# Altium schematic sheet Motor.SchDoc
size A4; SheetNumber: 4; SheetTotal: 12
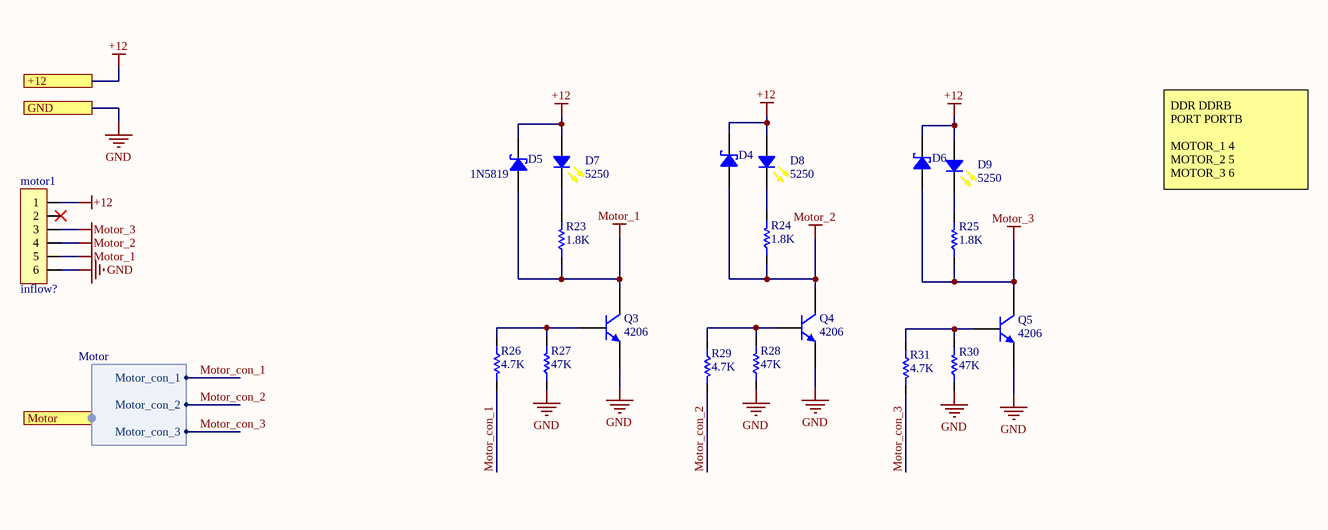
[diagram p0: Motor.SchDoc]

## Parts
D4  1N5819  [430X270D]  (value not drawn)
D5  1N5819  [430X270D]
D6  1N5819  [430X270D]  (value not drawn)
D7  Inflow: 5250  [LED 1206/3216 YELLOW]  (hidden comment: Yellow, 1206)
D8  Inflow: 5250  [LED 1206/3216 YELLOW]  (hidden comment: Yellow, 1206)
D9  Inflow: 5250  [LED 1206/3216 YELLOW]  (hidden comment: Yellow, 1206)
motor1  Inflow: inflow?  [MOLEX KK 0022272061]  (hidden comment: 6'Pin)
Q3  Inflow: 4206  [TO-220 AB]  (hidden comment: NPN)
Q4  Inflow: 4206  [TO-220 AB]  (hidden comment: NPN)
Q5  Inflow: 4206  [TO-220 AB]  (hidden comment: NPN)
R23  1.8K  [RES 1206 (3216X08L)]
R24  1.8K  [RES 1206 (3216X08L)]
R25  1.8K  [RES 1206 (3216X08L)]
R26  4.7K  [RES 1206 (3216X08L)]
R27  47K  [RES 1206 (3216X08L)]
R28  47K  [RES 1206 (3216X08L)]
R29  4.7K  [RES 1206 (3216X08L)]
R30  47K  [RES 1206 (3216X08L)]
R31  4.7K  [RES 1206 (3216X08L)]

## Ports
+12, GND, Motor (harness Motor)

## Harnesses
Motor: Motor_con_1, Motor_con_2, Motor_con_3

## Nets
+12: D4.2 D5.2 D6.2 D7.1 D8.1 D9.1 motor1.1 ; port +12
GND: motor1.6 Q3.3(E) Q4.3(E) Q5.3(E) R27.1 R28.1 R30.1 ; port GND
Motor_1: D5.1 motor1.5 Q3.2(C) R23.1
Motor_2: D4.1 motor1.4 Q4.2(C) R24.1
Motor_3: D6.1 motor1.3 Q5.2(C) R25.1
Motor_con_1: R26.2 ; port Motor.Motor_con_1
Motor_con_2: R29.2 ; port Motor.Motor_con_2
Motor_con_3: R31.2 ; port Motor.Motor_con_3
NetD7_2: D7.2 R23.2
NetD8_2: D8.2 R24.2
NetD9_2: D9.2 R25.2
NetQ3_1: Q3.1(B) R26.1 R27.2
NetQ4_1: Q4.1(B) R28.2 R29.1
NetQ5_1: Q5.1(B) R30.2 R31.1

Not connected (* = marked no-connect by the designer): motor1 2*

## Notes on the sheet
- DDR DDRB
  PORT PORTB
  MOTOR_1 4
  MOTOR_2 5
  MOTOR_3 6

## Library data of the parts
D4-D6 = Semi_Diod_Sch_1N5819_SMD: Schottky Rectifiers; Rating: Rating?; Validation: Valid; Inflow: inflow?; Package: SMA; Type: Schottky; Value: 1N5819
D7-D9 = Semi_LED_Yellow_1206: LED; Rating: Rating?; Type: Type?; Validation: Valid; Value: Yellow, 1206; Package: Package?
motor1 = Con_Signal_6: Signal Connector 6'Pin; Rating: Rating?; Validation: Valid; Value: 6'Pin; Package: Package?; Type: Type?
Q3-Q5 = Semi_BJT_TIP41C: NPN Power transistor; Rating: Rating?; Type: Type?; Validation: NT; Value: NPN; Package: Package?
R23-R31 = Res_SMD_1206: Resistor; Inflow: inflow?; Rating: 0.25W; Validation: Valid; Package: 1206; Type: 10%
  R23-R25: Value: 1.8K
  R26 R29 R31: Value: 4.7K
  R27 R28 R30: Value: 47K